# Altium project Orion-Bridge-R1.PrjPcb
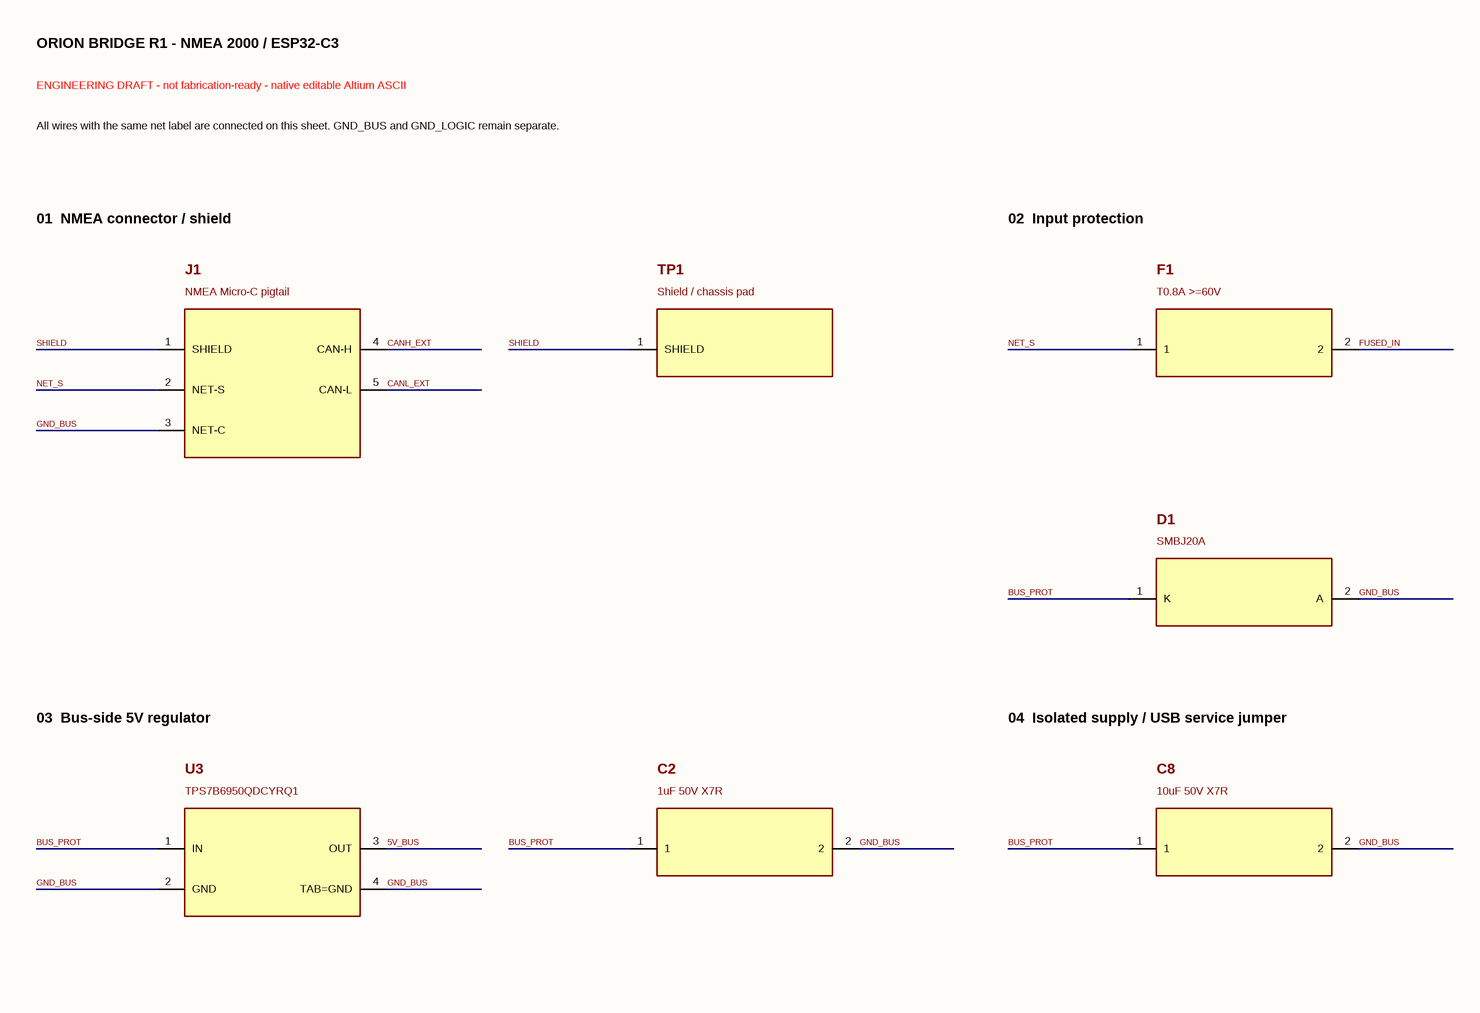
[diagram p0: Orion-Bridge-R1.SchDoc, top left]
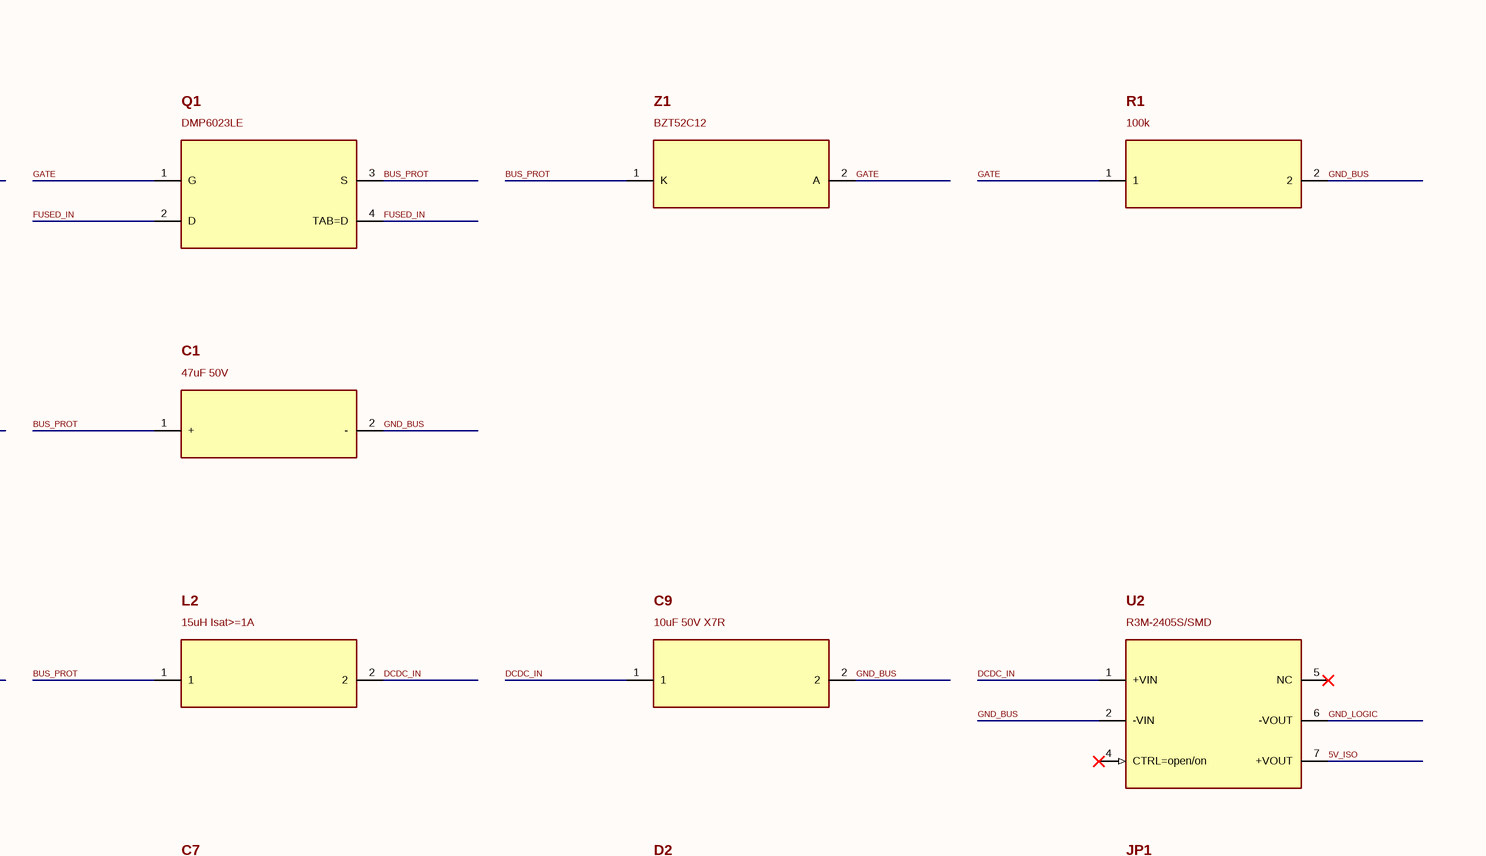
[diagram p1: Orion-Bridge-R1.SchDoc, top right]
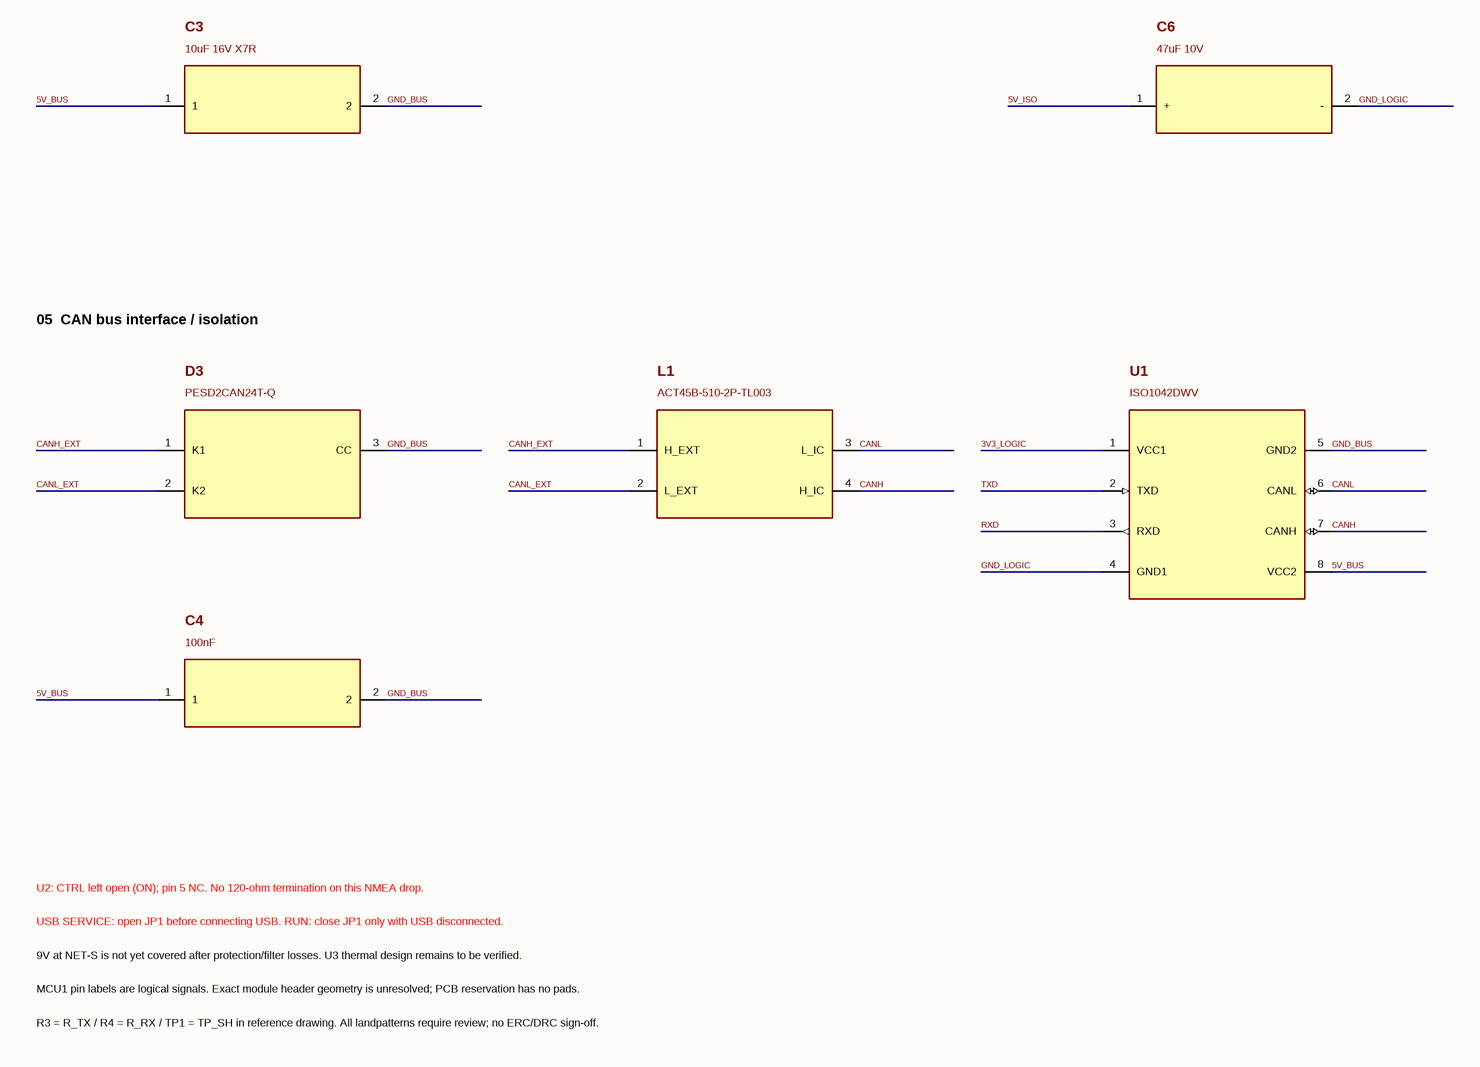
[diagram p2: Orion-Bridge-R1.SchDoc, bottom left]
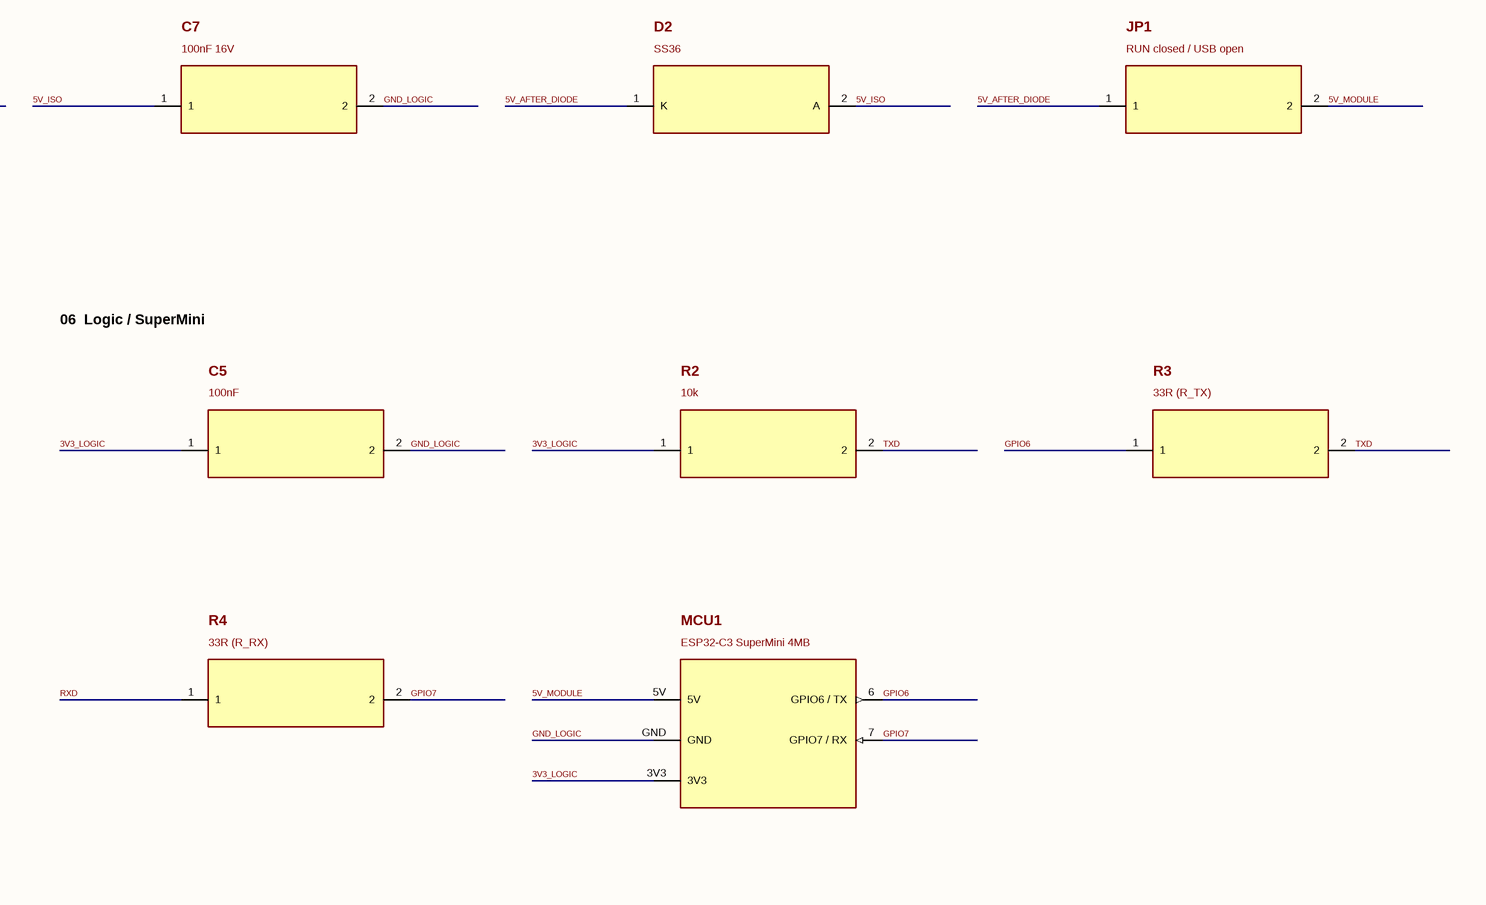
[diagram p3: Orion-Bridge-R1.SchDoc, bottom right]
1 sheet, 28 parts. Net scope: global (net labels, ports and power ports of the same name join across sheets).
Board file: Orion-Bridge-R1.PcbDoc

## Sheet Orion-Bridge-R1.SchDoc
size A2

### Parts
C1  47uF 50V  [TBD_CAP_RADIAL_P2.5_D8]
C2  1uF 50V X7R  [C0805]
C3  10uF 16V X7R  [C1206]
C4  100nF  [C0805]
C5  100nF  [C0805]
C6  47uF 10V  [TBD_CAP_RADIAL_P2.5_D6.3]
C7  100nF 16V  [C0805]
C8  10uF 50V X7R  [C1210]
C9  10uF 50V X7R  [C1210]
D1  SMBJ20A  [SMB]
D2  SS36  [SMB]
D3  PESD2CAN24T-Q  [SOT23]
F1  T0.8A >=60V  [TBD_FUSE_9X6]
J1  NMEA Micro-C pigtail  [TBD_TERMINAL_5_3.5]
JP1  RUN closed / USB open  [HDR1X2_2.54]
L1  ACT45B-510-2P-TL003  [ACT45B]
L2  15uH Isat>=1A  [TBD_INDUCTOR_5X5]
MCU1  ESP32-C3 SuperMini 4MB  [TBD_SUPERMINI_NO_PADS]
Q1  DMP6023LE  [SOT223_PMOS]
R1  100k  [R0805]
R2  10k  [R0805]
R3  33R (R_TX)  [R0805]
R4  33R (R_RX)  [R0805]
TP1  Shield / chassis pad  [TESTPOINT_2MM]
U1  ISO1042DWV  [SOIC8_DWV]
U2  R3M-2405S/SMD  [R3M_SMD]
U3  TPS7B6950QDCYRQ1  [SOT223_LDO]
Z1  BZT52C12  [SOD123]

### Nets
3V3_LOGIC: C5.1 MCU1.3V3 R2.1 U1.1(VCC1)
5V_AFTER_DIODE: D2.1(K) JP1.1
5V_BUS: C3.1 C4.1 U1.8(VCC2) U3.3(OUT)
5V_ISO: C6.1(+) C7.1 D2.2(A) U2.7(+VOUT)
5V_MODULE: JP1.2 MCU1.5V
BUS_PROT: C1.1(+) C2.1 C8.1 D1.1(K) L2.1 Q1.3(S) U3.1(IN) Z1.1(K)
CANH: L1.4(H_IC) U1.7(CANH)
CANH_EXT: D3.1(K1) J1.4(CAN-H) L1.1(H_EXT)
CANL: L1.3(L_IC) U1.6(CANL)
CANL_EXT: D3.2(K2) J1.5(CAN-L) L1.2(L_EXT)
DCDC_IN: C9.1 L2.2 U2.1(+VIN)
FUSED_IN: F1.2 Q1.2(D) Q1.4(TAB=D)
GATE: Q1.1(G) R1.1 Z1.2(A)
GND_BUS: C1.2(-) C2.2 C3.2 C4.2 C8.2 C9.2 D1.2(A) D3.3(CC) J1.3(NET-C) R1.2 U1.5(GND2) U2.2(-VIN) U3.2(GND) U3.4(TAB=GND)
GND_LOGIC: C5.2 C6.2(-) C7.2 MCU1.GND U1.4(GND1) U2.6(-VOUT)
GPIO6: MCU1.6(GPIO6_/_TX) R3.1
GPIO7: MCU1.7(GPIO7_/_RX) R4.2
NET_S: F1.1 J1.2(NET-S)
RXD: R4.1 U1.3(RXD)
SHIELD: J1.1(SHIELD) TP1.1(SHIELD)
TXD: R2.2 R3.2 U1.2(TXD)

Not connected (* = marked no-connect by the designer): U2 4(CTRL=open/on)* 5(NC)*

### Notes on the sheet
- ORION BRIDGE R1 - NMEA 2000 / ESP32-C3
- ENGINEERING DRAFT - not fabrication-ready - native editable Altium ASCII
- All wires with the same net label are connected on this sheet. GND_BUS and GND_LOGIC remain separate.
- 01  NMEA connector / shield
- 02  Input protection
- 03  Bus-side 5V regulator
- 04  Isolated supply / USB service jumper
- 05  CAN bus interface / isolation
- 06  Logic / SuperMini
- U2: CTRL left open (ON); pin 5 NC. No 120-ohm termination on this NMEA drop.
- USB SERVICE: open JP1 before connecting USB. RUN: close JP1 only with USB disconnected.
- 9V at NET-S is not yet covered after protection/filter losses. U3 thermal design remains to be verified.
- MCU1 pin labels are logical signals. Exact module header geometry is unresolved; PCB reservation has no pads.
- R3 = R_TX / R4 = R_RX / TP1 = TP_SH in reference drawing. All landpatterns require review; no ERC/DRC sign-off.

### Library data of the parts
C1 = C1_R1: ReviewStatus: PROVISIONAL - verify landpattern before fabrication
C2 = C2_R1: ReviewStatus: PROVISIONAL - verify landpattern before fabrication
C3 = C3_R1: ReviewStatus: PROVISIONAL - verify landpattern before fabrication
C4 = C4_R1: ReviewStatus: PROVISIONAL - verify landpattern before fabrication
C5 = C5_R1: ReviewStatus: PROVISIONAL - verify landpattern before fabrication
C6 = C6_R1: ReviewStatus: PROVISIONAL - verify landpattern before fabrication
C7 = C7_R1: ReviewStatus: PROVISIONAL - verify landpattern before fabrication
C8 = C8_R1: ReviewStatus: PROVISIONAL - verify landpattern before fabrication
C9 = C9_R1: ReviewStatus: PROVISIONAL - verify landpattern before fabrication
D1 = D1_R1: ReviewStatus: PROVISIONAL - verify landpattern before fabrication
D2 = D2_R1: ReviewStatus: PROVISIONAL - verify landpattern before fabrication
D3 = D3_R1: ReviewStatus: PROVISIONAL - verify landpattern before fabrication
F1 = F1_R1: ReviewStatus: PROVISIONAL - verify landpattern before fabrication
J1 = J1_R1: ReviewStatus: TBD terminal MPN, pitch and pin order; logical Micro-C numbering, not a connector face view
JP1 = JP1_R1: ReviewStatus: PROVISIONAL - verify landpattern before fabrication
L1 = L1_R1: ReviewStatus: PROVISIONAL - verify landpattern before fabrication
L2 = L2_R1: ReviewStatus: PROVISIONAL - verify landpattern before fabrication
MCU1 = MCU1_R1: ReviewStatus: MECHANICAL RESERVATION ONLY: no pads; measure exact module header positions and map pins before ECO/routing
Q1 = Q1_R1: ReviewStatus: PROVISIONAL - verify landpattern before fabrication
R1 = R1_R1: ReviewStatus: PROVISIONAL - verify landpattern before fabrication
R2 = R2_R1: ReviewStatus: PROVISIONAL - verify landpattern before fabrication
R3 = R3_R1: ReviewStatus: PROVISIONAL - verify landpattern before fabrication
R4 = R4_R1: ReviewStatus: PROVISIONAL - verify landpattern before fabrication
TP1 = TP1_R1: ReviewStatus: PROVISIONAL - verify landpattern before fabrication
U1 = U1_R1: ReviewStatus: PROVISIONAL - verify landpattern before fabrication
U2 = U2_R1: ReviewStatus: PROVISIONAL - verify landpattern before fabrication
U3 = U3_R1: ReviewStatus: PROVISIONAL - verify landpattern before fabrication
Z1 = Z1_R1: ReviewStatus: PROVISIONAL - verify landpattern before fabrication